# Altium schematic sheet Controller_Section.SchDoc
size A4; SheetNumber: 3; SheetTotal: 8
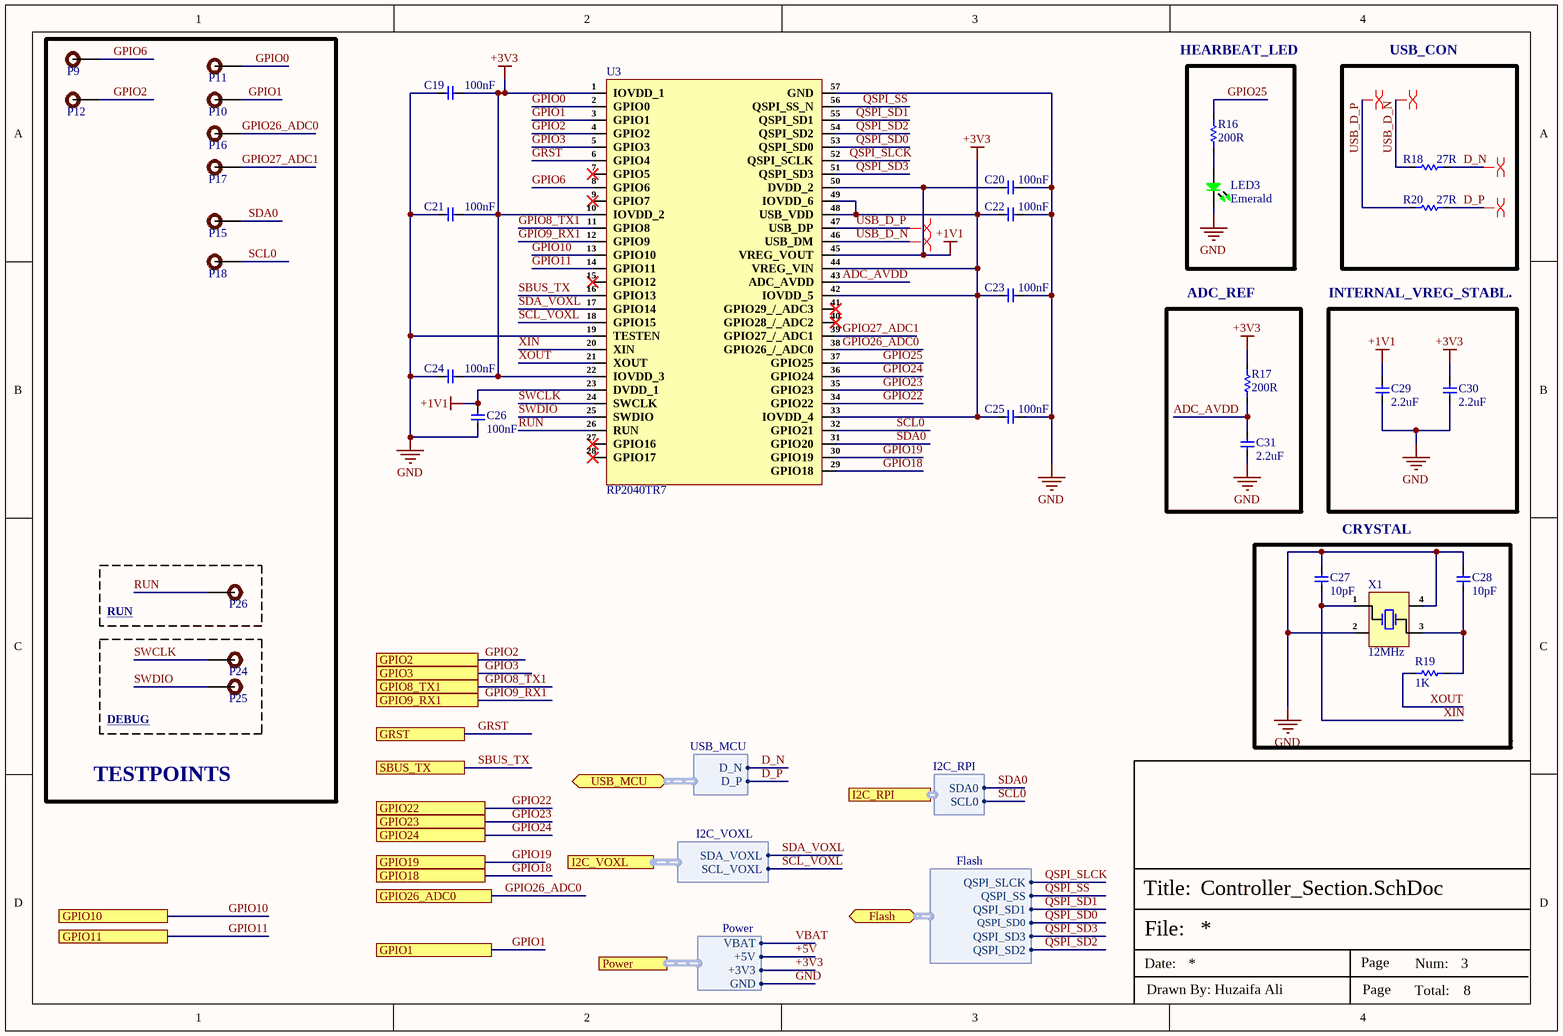
[diagram p0: Controller_Section.SchDoc]

## Parts
C19  100nF  [cap-0402]
C20  100nF  [cap-0402]
C21  100nF  [cap-0402]
C22  100nF  [cap-0402]
C23  100nF  [cap-0402]
C24  100nF  [cap-0402]
C25  100nF  [cap-0402]
C26  100nF  [cap-0402]
C27  10pF  [Cap-0402]
C28  10pF  [Cap-0402]
C29  2.2uF  [Cap-0402]
C30  2.2uF  [Cap-0402]
C31  2.2uF  [Cap-0402]
LED3  Emerald  [LED-0603]
P9  TEST POINT  [Test-point]  (value not drawn)
P10  TEST POINT  [Test-point]  (value not drawn)
P11  TEST POINT  [Test-point]  (value not drawn)
P12  TEST POINT  [Test-point]  (value not drawn)
P15  TEST POINT  [Test-point]  (value not drawn)
P16  TEST POINT  [Test-point]  (value not drawn)
P17  TEST POINT  [Test-point]  (value not drawn)
P18  TEST POINT  [Test-point]  (value not drawn)
P24  TEST POINT  [Test-point]  (value not drawn)
P25  TEST POINT  [Test-point]  (value not drawn)
P26  TEST POINT  [Test-point]  (value not drawn)
R16  200R  [Res-0402]
R17  200R  [Res-0402]
R18  27R  [Res-0402]
R19  1K  [Res-0402]
R20  27R  [Res-0402]
U3  RP2040TR7  [QFN-56 (7x7)]
X1  12MHz  [MCSJK-7U-12.00-10-10-80-B-10]

## Blocks framed on the sheet
TESTPOINTS: P9-P12 P15-P18
USB_CON: R18 R20
ADC_REF: C31 R17
INTERNAL_VREG_STABL.: C29 C30
RUN: P26
DEBUG: P24 P25

## Ports
Flash (bidir, harness Flash, see Top-Sheet[3A], FlashMemory_Section[2D]), GPIO1 (see Top-Sheet[2C], Power_Section[2D]), GPIO2 (see Top-Sheet[2B], Connector_Section[3C]), GPIO3 (see Top-Sheet[2B], Connector_Section[3C]), GPIO8_TX1 (see Top-Sheet[2B], Connector_Section[3C]), GPIO9_RX1 (see Top-Sheet[2B], Connector_Section[3D]), GPIO10 (see Top-Sheet[2C], Power_Section[2D]), GPIO11 (see Top-Sheet[3B], WiFiModule_Section[3D]), GPIO18 (see Top-Sheet[2C], Connector_Section[4D], Power_Section[2D]), GPIO19 (see Top-Sheet[2C], Power_Section[2D]), GPIO22 (see Top-Sheet[2B], Power_Section[2D]), GPIO23 (see Top-Sheet[2B], Power_Section[2D]), GPIO24 (see Top-Sheet[2B], Power_Section[2D]), GPIO26_ADC0 (see Top-Sheet[2C], Power_Section[1D]), GRST (see Top-Sheet[3C], USB HUB_Section[1D]), I2C_RPI (harness I2C_RPI, see Top-Sheet[2B], Connector_Section[2D]), I2C_VOXL (harness I2C_VOXL, see Top-Sheet[2A], Connector_Section[2D], RTC_Section[2D]), Power (harness Power, see Top-Sheet[2A], Connector_Section[4D], FlashMemory_Section[1D], Power_Section[3D], RTC_Section[2D], USB HUB_Section[1D], WiFiModule_Section[3D]), SBUS_TX (see Top-Sheet[2B], Connector_Section[1D]), USB_MCU (bidir, harness USB_MCU, see Top-Sheet[3C], USB HUB_Section[3D])

## Harnesses
Flash: QSPI_SLCK, QSPI_SS, QSPI_SD1, QSPI_SD3, QSPI_SD0, QSPI_SD2
Power: +5V, +3V3, GND, VBAT
I2C_RPI: SDA0, SCL0
USB_MCU: D_N, D_P
I2C_VOXL: SCL_VOXL, SDA_VOXL

## Nets
+1V1: C20.1 C26.2 C29.2 U3.23(DVDD_1) U3.45(VREG_VOUT) U3.50(DVDD_2)
+3V3: C19.2 C21.2 C22.1 C23.1 C24.2 C25.1 C30.2 R17.2 U3.1(IOVDD_1) U3.10(IOVDD_2) U3.22(IOVDD_3) U3.33(IOVDD_4) U3.42(IOVDD_5) U3.44(VREG_VIN) U3.48(USB_VDD) U3.49(IOVDD_6) ; port Power.+3V3
GND: C19.1 C20.2 C21.1 C22.2 C23.2 C24.1 C25.2 C26.1 C27.2 C28.2 C29.1 C30.1 C31.1 LED3.2 U3.19(TESTEN) U3.57(GND) X1.2(GND) X1.4(VDD) ; port Power.GND
+5V: port Power.+5V
ADC_AVDD: C31.2 R17.1 U3.43(ADC_AVDD)
D_N: R18.2 ; port USB_MCU.D_N
D_P: R20.2 ; port USB_MCU.D_P
GPIO0: P11.1 U3.2(GPIO0)
GPIO1: P10.1 U3.3(GPIO1) ; port GPIO1
GPIO2: P12.1 U3.4(GPIO2) ; port GPIO2
GPIO3: U3.5(GPIO3) ; port GPIO3
GPIO6: P9.1 U3.8(GPIO6)
GPIO8_TX1: U3.11(GPIO8) ; port GPIO8_TX1
GPIO9_RX1: U3.12(GPIO9) ; port GPIO9_RX1
GPIO10: U3.13(GPIO10) ; port GPIO10
GPIO11: U3.14(GPIO11) ; port GPIO11
GPIO18: U3.29(GPIO18) ; port GPIO18
GPIO19: U3.30(GPIO19) ; port GPIO19
GPIO22: U3.34(GPIO22) ; port GPIO22
GPIO23: U3.35(GPIO23) ; port GPIO23
GPIO24: U3.36(GPIO24) ; port GPIO24
GPIO25: R16.2 U3.37(GPIO25)
GPIO26_ADC0: P16.1 U3.38(GPIO26_/_ADC0) ; port GPIO26_ADC0
GPIO27_ADC1: P17.1 U3.39(GPIO27_/_ADC1)
GRST: U3.6(GPIO4) ; port GRST
QSPI_SD0: U3.53(QSPI_SD0) ; port Flash.QSPI_SD0
QSPI_SD1: U3.55(QSPI_SD1) ; port Flash.QSPI_SD1
QSPI_SD2: U3.54(QSPI_SD2) ; port Flash.QSPI_SD2
QSPI_SD3: U3.51(QSPI_SD3) ; port Flash.QSPI_SD3
QSPI_SLCK: U3.52(QSPI_SCLK) ; port Flash.QSPI_SLCK
QSPI_SS: U3.56(QSPI_SS_N) ; port Flash.QSPI_SS
RUN: P26.1 U3.26(RUN)
SBUS_TX: U3.16(GPIO13) ; port SBUS_TX
SCL0: P18.1 U3.32(GPIO21) ; port I2C_RPI.SCL0
SCL_VOXL: U3.18(GPIO15) ; port I2C_VOXL.SCL_VOXL
SDA0: P15.1 U3.31(GPIO20) ; port I2C_RPI.SDA0
SDA_VOXL: U3.17(GPIO14) ; port I2C_VOXL.SDA_VOXL
SWCLK: P24.1 U3.24(SWCLK)
SWDIO: P25.1 U3.25(SWDIO)
USB_D_N: R18.1 U3.46(USB_DM)
USB_D_P: R20.1 U3.47(USB_DP)
VBAT: port Power.VBAT
XIN: C27.1 U3.20(XIN) X1.1(ENABLE_CONTROL)
XOUT: R19.1 U3.21(XOUT)
NetC28_1: C28.1 R19.2 X1.3(OUT_PUT)
NetLED3_1: LED3.1 R16.1

Not connected (* = marked no-connect by the designer): U3 7(GPIO5)* 9(GPIO7)* 15(GPIO12)* 27(GPIO16)* 28(GPIO17)* 40(GPIO28_/_ADC2)* 41(GPIO29_/_ADC3)*

## Layout directives
differential pair; net class USB_D; differential pair class USB_D_Lines; rule Matched Net Lengths [Tolerance = 0.508mm]; rule Impedance Constraint [Min = 88.00    Max = 102.0    ]: USB_D_N, USB_D_P
differential pair; rule Impedance Constraint [Min = 88.00    Max = 102.0    ]; rule Matched Net Lengths [Tolerance = 0.508mm]; net class D; differential pair class D_Lines: D_N, D_P

## Notes on the sheet
- HEARBEAT_LED
- (near C27) CRYSTAL
- File:
- Title:
- Date:
- Page
- Num:
- Total:
- Drawn By: Huzaifa Ali

## Library data of the parts
C19-C26 = C1005X7R1H104KT000F: CAP CER 0.1UF 50V X7R 0402; Manufacturer: TDK; Tolerance: 10%; Voltage: 25V; Item Type: Capacitor; Supplier 1: Avnet; Manufacturer Part Number: C1005X7R1H104KT000F; RoHS: No; Category: Ceramic Capacitors; Dielectric: X7R; Supplier Part Number 1: C1005X7R1H104KT000F; LCSC Part Number: C361198; ComponentLink1Description: LCSC; ComponentLink1URL: https://www.lcsc.com/product-detail/Multilayer-Ceramic-Capacitors-MLCC-SMD-SMT_TDK-C1005X7R1H104KT000F_C361198.html
C27 C28 = GRM1555C1H100JA01D: CAP CER 10PF 50V C0G/NP0 0402; Manufacturer: Murata; Material: Ceramic; Dielectric: C0G; Tolerance: 5%; Item Type: Capacitor; Supplier: Arrow Electronics; Supplier Part Number: GRM1555C1H100JA01D; Manufacturer Part Number: GRM1555C1H100JA01D; RoHS: Yes; Category: Ceramic Capacitors; Stock: 3860000; Pricing: 10000=0.0034, 50000=0.0027, 100000=0.0023, 250000=0.0021 (USD); Mounting Technology: Surface Mount; Case/Package: 0402; Case Code (Metric): 1005; Case Code (Imperial): 0402; Min Operating Temperature: -55°C; Max Operating Temperature: 125°C; Value: 10pF; Voltage Rating: 50V; Packaging: Tape and Reel; Package Quantity: 1; Voltage Rating (DC): 50V; Termination: SMD/SMT; Series: GRM; Voltage: 50V; Construction: Flat; Length: 1mm; Width: 0.02inch; Height: 0.5mm; Depth: 0.5mm; Thickness: 0.022inch; Radiation Hardening: No; RoHS Compliant: Yes; Lead Free: Lead Free; Reach SVHC Compliant: No; ComponentLink1URL: https://datasheet.ciiva.com/2989/product-2989280.pdf?src-supplier=Avnet; ComponentLink1Description: https://datasheet.ciiva.com/2989/product-2989280.pdf?src-supplier=Avnet; ComponentLink2URL: https://datasheet.ciiva.com/18184/getdatasheetpartid-307234-18184164.pdf?src-supplier=Verical; ComponentLink2Description: https://datasheet.ciiva.com/18184/getdatasheetpartid-307234-18184164.pdf?src-supplier=Verical; ComponentLink3URL: https://datasheet.ciiva.com/29200/453545-da-01-en-vs-kondensator-0402-29200107.pdf?src-supplier=Conrad; ComponentLink3Description: https://datasheet.ciiva.com/29200/453545-da-01-en-vs-kondensator-0402-29200107.pdf?src-supplier=Conrad; ComponentLink4URL: https://datasheet.ciiva.com/7828/1666664-7828812.pdf?src-supplier=Element14; ComponentLink4Description: https://datasheet.ciiva.com/7828/1666664-7828812.pdf?src-supplier=Element14; ComponentLink5URL: https://datasheet.ciiva.com/6271/partnumbering-e-01-6271159.pdf?src-supplier=Digi-Key; ComponentLink5Description: https://datasheet.ciiva.com/6271/partnumbering-e-01-6271159.pdf?src-supplier=Digi-Key; ComponentLink6URL: https://datasheet.ciiva.com/6271/partnumbering-e-01-6271158.pdf?src-supplier=Digi-Key; ComponentLink6Description: https://datasheet.ciiva.com/6271/partnumbering-e-01-6271158.pdf?src-supplier=Digi-Key; ComponentLink7URL: https://datasheet.ciiva.com/6271/partnumbering-e-01-6271068.pdf?src-supplier=Digi-Key; ComponentLink7Description: https://datasheet.ciiva.com/6271/partnumbering-e-01-6271068.pdf?src-supplier=Digi-Key; LCSC Part Number: C76946
C29-C31 = GRM155R61E225KE11D: CAP CER 2.2UF 25V X5R 0402; Manufacturer: Murata; Material: Ceramic; Tolerance: 10%; Item Type: Capacitor; Supplier 1: Avnet; Manufacturer Part Number: GRM155R61E225KE11D; RoHS: Yes; Category: Ceramic Capacitors; Stock 1: 210000; Pricing 1: 10000=0.03830, 20000=0.03623, 40000=0.03416, 60000=0.03209, 80000=0.03002, 100000=0.02795, 1000000=0.02588 (USD); Mount: Surface Mount; Case/Package: 0402; Case Code (Metric): 1005; Case Code (Imperial): 0402; Weight: 0.000212oz; Min Operating Temperature: -55°C; Max Operating Temperature: 85°C; Dielectric: X5R; Capacitance: 2.2uF; Packaging: Tape and Reel; Voltage Rating: 25V; Termination: SMD/SMT; Resistor Type: Ceramic; Voltage Rating (DC): 25V; Package Quantity: 10000; Length: 1mm; Width: 0.5mm; Height: 0.5mm; Thickness: 0.022inch; Lead Free: Lead Free; RoHS Compliant: Yes; ComponentLink1URL: http://www.mouser.com/ds/2/281/c02e-2905.pdf?src-supplier=Mouser; ComponentLink1Description: http://www.mouser.com/ds/2/281/c02e-2905.pdf?src-supplier=Mouser; ComponentLink2URL: http://search.murata.co.jp/Ceramy/image/img/A01X/G101/ENG/GRM155R61E225KE11-01.pdf?src-supplier=Digi-Key; ComponentLink2Description: http://search.murata.co.jp/Ceramy/image/img/A01X/G101/ENG/GRM155R61E225KE11-01.pdf?src-supplier=Digi-Key; ComponentLink3URL: http://search.murata.co.jp/Ceramy/image/img/A01X/partnumbering_e_01.pdf?src-supplier=Digi-Key; ComponentLink3Description: http://search.murata.co.jp/Ceramy/image/img/A01X/partnumbering_e_01.pdf?src-supplier=Digi-Key; ComponentLink4URL: http://psearch.en.murata.com/capacitor/product/GRM155R61E225KE11%23.pdf?src-supplier=Avnet; ComponentLink4Description: http://psearch.en.murata.com/capacitor/product/GRM155R61E225KE11%23.pdf?src-supplier=Avnet; Supplier Part Number 1: GRM155R61E225KE11D; LCSC Part Number: C385032
LED3 = NCD0603G2: Emerald 0603 Light Emitting Diodes (LED) ROHS; Manufacturer: Foshan NationStar Optoelectronics; Manufacturer Part Number: NCD0603G2; Package: 0603; LCSC Part Number: C87326; Item Type: LED; ComponentLink1Description: LCSC; ComponentLink1URL: https://www.lcsc.com/product-detail/Light-Emitting-Diodes-LED_Foshan-NationStar-Optoelectronics-NCD0603G2_C87326.html
P9-P12 P15-P18 P24-P26 = TEST POINT: Test Point ON; Item Type: TEST POINT; Manufacturer Part Number: TEST POINT
R16 R17 = RC0402FR-07200RL: RES 200 OHM 1% 1/16W 0402; Manufacturer: Yageo; Temperature Coefficient: 100ppm/°C; Power Rating: 63mW; Voltage Rating (DC): 50V; Supplier 1: Digi-Key; Manufacturer Part Number: RC0402FR-07200RL; RoHS: Yes; Category: Chip SMD Resistors; Stock 1: 19778; Pricing 1: 1=0.10000, 10=0.01600, 100=0.00660, 1000=0.00299, 2500=0.00259, 5000=0.00214 (USD); Case/Package: 0402; Case Code (Metric): 1005; Case Code (Imperial): 0402; Size Code: 0402; Min Operating Temperature: -55°C; Max Operating Temperature: 155°C; Tolerance: 1%; Resistance: 200R; Resistor Type: Thick Film; Packaging: Tape and Reel; Voltage Rating: 50V; Package Quantity: 1; Number of Terminations: 2; Termination: SMD/SMT; Max Power Dissipation: 63mW; Features: Moisture Resistant; Series: RC; Construction: Rectangular; Resistance Tolerance: 1%; Length: 1mm; Width: 0.02inch; Height: 0.016inch; Depth: 0.5mm; REACH SVHC: No SVHC; Lead Free: Lead Free; RoHS Compliant: Yes; Military Standard: Not; ComponentLink1URL: https://datasheet.ciiva.com/2553/pyu-r-int-thick-7-2553232.pdf?src-supplier=Digi-Key; ComponentLink1Description: https://datasheet.ciiva.com/2553/pyu-r-int-thick-7-2553232.pdf?src-supplier=Digi-Key; ComponentLink2URL: https://datasheet.ciiva.com/7983/1018594-7983509.pdf?src-supplier=Element14; ComponentLink2Description: https://datasheet.ciiva.com/7983/1018594-7983509.pdf?src-supplier=Element14; ComponentLink3URL: https://datasheet.ciiva.com/16804/pyu-rc0402-51-rohs-l-6-r-16804406.pdf?src-supplier=Future+Electronics; ComponentLink3Description: https://datasheet.ciiva.com/16804/pyu-rc0402-51-rohs-l-6-r-16804406.pdf?src-supplier=Future+Electronics; ComponentLink4URL: https://datasheet.ciiva.com/15189/getdatasheetpartid-331152-15189383.pdf?src-supplier=Verical; ComponentLink4Description: https://datasheet.ciiva.com/15189/getdatasheetpartid-331152-15189383.pdf?src-supplier=Verical; ComponentLink5URL: https://datasheet.ciiva.com/7849/1018594-7849898.pdf?src-supplier=Element14; ComponentLink5Description: https://datasheet.ciiva.com/7849/1018594-7849898.pdf?src-supplier=Element14; ComponentLink6URL: https://datasheet.ciiva.com/5562/pyu-rc0402-51-rohs-l-6-r-8721-5562539.pdf?src-supplier=Mouser; ComponentLink6Description: https://datasheet.ciiva.com/5562/pyu-rc0402-51-rohs-l-6-r-8721-5562539.pdf?src-supplier=Mouser; ComponentLink7URL: https://datasheet.ciiva.com/7849/1018594-7849899.pdf?src-supplier=Element14; ComponentLink7Description: https://datasheet.ciiva.com/7849/1018594-7849899.pdf?src-supplier=Element14; ComponentLink8URL: https://datasheet.ciiva.com/2553/pyu-r-int-thick-7-2553230.pdf?src-supplier=Digi-Key; ComponentLink8Description: https://datasheet.ciiva.com/2553/pyu-r-int-thick-7-2553230.pdf?src-supplier=Digi-Key; ComponentLink9URL: https://datasheet.ciiva.com/2553/pyu-r-int-thick-7-2553231.pdf?src-supplier=Digi-Key; ComponentLink9Description: https://datasheet.ciiva.com/2553/pyu-r-int-thick-7-2553231.pdf?src-supplier=Digi-Key; Supplier Part Number 1: 311-200LRCT-ND; LCSC Part Number: C114764
R18 R20 = CRGCQ0402F27R: SMD Chip Resistor, 27 Ohm, ± 1%, 63 mW, 0402 [1005 Metric], Thick Film, General Purpose; Manufacturer: TE Connectivity; Operating Supply Voltage: 50V; Power Rating: 62.5mW; Supplier: Digikey; Supplier Part Number: A129608CT-ND; Manufacturer Part Number: CRGCQ0402F27R; RoHS: Yes; Category: Chip SMD Resistors; Stock: 81404; Pricing: 1=0.1, 10=0.02, 50=0.0126, 100=0.0105, 500=0.00708, 1000=0.00609, 5000=0.00442 (USD); Voltage Rating: 50V; Voltage Rating (DC): 50V; Height: 400um; ComponentLink1URL: http://datasheet.octopart.com/CRGCQ0402F27R-TE-Connectivity-datasheet-114679081.pdf?src-supplier=Farnell; ComponentLink1Description: http://datasheet.octopart.com/CRGCQ0402F27R-TE-Connectivity-datasheet-114679081.pdf?src-supplier=Farnell; ComponentLink2URL: http://datasheet.octopart.com/CRGCQ0402F27R-TE-Connectivity-datasheet-114679081.pdf?src-supplier=Mouser; ComponentLink2Description: http://datasheet.octopart.com/CRGCQ0402F27R-TE-Connectivity-datasheet-114679081.pdf?src-supplier=Mouser; ComponentLink3URL: http://datasheet.octopart.com/CRGCQ0402F27R-TE-Connectivity-datasheet-114679081.pdf?src-supplier=Avnet; ComponentLink3Description: http://datasheet.octopart.com/CRGCQ0402F27R-TE-Connectivity-datasheet-114679081.pdf?src-supplier=Avnet; ComponentLink4URL: https://www.te.com/commerce/DocumentDelivery/DDEController?Action=srchrtrv&amp;DocNm=1773204-3&amp;DocType=DS&amp;DocLang=English&src-supplier=Digikey; ComponentLink4Description: https://www.te.com/commerce/DocumentDelivery/DDEController?Action=srchrtrv&amp;DocNm=1773204-3&amp;DocType=DS&amp;DocLang=English&src-supplier=Digikey; ComponentLink5URL: http://datasheet.octopart.com/CRGCQ0402F27R-TE-Connectivity-datasheet-114679081.pdf?src-supplier=Digikey; ComponentLink5Description: http://datasheet.octopart.com/CRGCQ0402F27R-TE-Connectivity-datasheet-114679081.pdf?src-supplier=Digikey; ComponentLink6URL: http://datasheet.octopart.com/CRGCQ0402F27R-TE-Connectivity-datasheet-114679081.pdf?src-supplier=Newark; ComponentLink6Description: http://datasheet.octopart.com/CRGCQ0402F27R-TE-Connectivity-datasheet-114679081.pdf?src-supplier=Newark; ComponentLink7URL: http://datasheet.octopart.com/CRGCQ0402F27R-TE-Connectivity-datasheet-114679081.pdf?src-supplier=Verical; ComponentLink7Description: http://datasheet.octopart.com/CRGCQ0402F27R-TE-Connectivity-datasheet-114679081.pdf?src-supplier=Verical; ComponentLink8URL: http://datasheet.octopart.com/CRGCQ0402F27R-TE-Connectivity-datasheet-114679081.pdf?src-supplier=Arrow+Electronics; ComponentLink8Description: http://datasheet.octopart.com/CRGCQ0402F27R-TE-Connectivity-datasheet-114679081.pdf?src-supplier=Arrow+Electronics; ComponentLink9URL: http://datasheet.octopart.com/CRGCQ0402F27R-TE-Connectivity-datasheet-114679081.pdf?src-supplier=Onlinecomponents.com; ComponentLink9Description: http://datasheet.octopart.com/CRGCQ0402F27R-TE-Connectivity-datasheet-114679081.pdf?src-supplier=Onlinecomponents.com; ComponentLink10URL: http://datasheet.octopart.com/CRGCQ0402F27R-TE-Connectivity-datasheet-114679081.pdf?src-supplier=Sager+Electronics; ComponentLink10Description: http://datasheet.octopart.com/CRGCQ0402F27R-TE-Connectivity-datasheet-114679081.pdf?src-supplier=Sager+Electronics; ComponentLink11URL: http://datasheet.octopart.com/CRGCQ0402F27R-TE-Connectivity-datasheet-114679081.pdf?src-supplier=Electro+Sonic; ComponentLink11Description: http://datasheet.octopart.com/CRGCQ0402F27R-TE-Connectivity-datasheet-114679081.pdf?src-supplier=Electro+Sonic; ComponentLink12URL: http://datasheet.octopart.com/CRGCQ0402F27R-TE-Connectivity-datasheet-114679081.pdf?src-supplier=Heilind+Electronics; ComponentLink12Description: http://datasheet.octopart.com/CRGCQ0402F27R-TE-Connectivity-datasheet-114679081.pdf?src-supplier=Heilind+Electronics; ComponentLink13URL: http://datasheet.octopart.com/CRGCQ0402F27R-TE-Connectivity-datasheet-114679081.pdf?src-supplier=Interstate+Connecting+Components; ComponentLink13Description: http://datasheet.octopart.com/CRGCQ0402F27R-TE-Connectivity-datasheet-114679081.pdf?src-supplier=Interstate+Connecting+Components; ComponentLink14URL: https://datasheet.octopart.com/CRGCQ0402F27R-TE-Connectivity-datasheet-114679081.pdf?src-supplier=Master+Electronics; ComponentLink14Description: https://datasheet.octopart.com/CRGCQ0402F27R-TE-Connectivity-datasheet-114679081.pdf?src-supplier=Master+Electronics; ComponentLink15URL: http://datasheet.octopart.com/CRGCQ0402F27R-TE-Connectivity-datasheet-114679081.pdf?src-supplier=TME; ComponentLink15Description: http://datasheet.octopart.com/CRGCQ0402F27R-TE-Connectivity-datasheet-114679081.pdf?src-supplier=TME
R19 = CRCW04021K00FKEDHP: RES SMD 1K OHM 1% 1/5W 0402; Manufacturer: Vishay Dale; Resistance: 1kR; Temperature Coefficient: 100ppm/°C; Power Rating: 125mW; Voltage Rating: 50V; Supplier 1: Digi-Key; Manufacturer Part Number: CRCW04021K00FKEDHP; Stock 1: 315989; Pricing 1: 1=0.15, 10=0.132, 100=0.0506, 1000=0.02226, 2500=0.01923, 5000=0.0172 (USD); Mount: Surface Mount; Case/Package: 0402; Number of Pins: 2; Contact Plating: Tin; Weight: 2.3E-05oz; Case Code (Imperial): 0402; Case Code (Metric): 1005; Size Code: 0402; Min Operating Temperature: -55°C; Max Operating Temperature: 155°C; Tolerance: 1%; Resistor Type: Thick Film; Package Quantity: 10; Packaging: Tape and Reel; Number of Terminations: 2; Termination: SMD/SMT; Max Power Dissipation: 125mW; Voltage Rating (DC): 50V; Features: Automotive AEC-Q200; Series: CRCW-HP; Construction: Rectangular; Technology: THICK FILM; Resistance Tolerance: 1%; Length: 1mm; Width: 0.5mm; Height: 0.3mm; Depth: 0.5mm; Radiation Hardening: No; REACH SVHC: Unknown; Military Standard: Not; Lead Free: Lead Free; RoHS Compliant: Yes; ComponentLink1URL: http://www.farnell.com/datasheets/2339608.pdf?src-supplier=Element14; ComponentLink1Description: http://www.farnell.com/datasheets/2339608.pdf?src-supplier=Element14; ComponentLink2URL: http://www.vishay.com/docs/20043/crcwhpe3.pdf?src-supplier=Digi-Key; ComponentLink2Description: http://www.vishay.com/docs/20043/crcwhpe3.pdf?src-supplier=Digi-Key; ComponentLink3URL: http://www.mouser.com/ds/2/427/crcwhpe3-46056.pdf?src-supplier=Mouser; ComponentLink3Description: http://www.mouser.com/ds/2/427/crcwhpe3-46056.pdf?src-supplier=Mouser; ComponentLink4URL: http://www.vishay.com/docs/20043/crcwhpe3.pdf?src-supplier=Avnet; ComponentLink4Description: http://www.vishay.com/docs/20043/crcwhpe3.pdf?src-supplier=Avnet; ComponentLink5URL: http://www.vishay.com/docs/20043/crcwhpe3.pdf?src-supplier=Future+Electronics; ComponentLink5Description: http://www.vishay.com/docs/20043/crcwhpe3.pdf?src-supplier=Future+Electronics; Supplier Part Number 1: 541-1.00KYCT-ND; LCSC Part Number: C313354
U3 = RP2040TR7: Rectifier Diode, 1 Phase, 1 Element, 2A, 400V V(RRM), Silicon, DO-15; Manufacturer: Raspberry Pi; Supplier: Farnell; Supplier Part Number: 3766079; Manufacturer Part Number: RP2040TR7; RoHS: No; Category: Uncategorized; Stock: 11495; Pricing: 500=0.645 (GBP)
X1 = MCSJK-7U-12.00-10-10-80-B-10: Crystal, 12Mhz, 10Pf, 3.2Mm X 2.5Mm Frequency Nom 12Mhz Crystal Case Smd Rohs; Manufacturer: Multicomp; Supplier: Newark; Supplier Part Number: 56AC8904; Manufacturer Part Number: MCSJK-7U-12.00-10-10-80-B-10; RoHS: Yes; Stock: 26807; Pricing: 1=0.428, 10=0.381, 100=0.3, 500=0.246, 1000=0.214, 5000=0.191, 10000=0.172, 25000=0.166 (USD); ComponentLink1URL: http://www.farnell.com/datasheets/2645227.pdf?src-supplier=Farnell; ComponentLink1Description: http://www.farnell.com/datasheets/2645227.pdf?src-supplier=Farnell; Item Type: Crystal